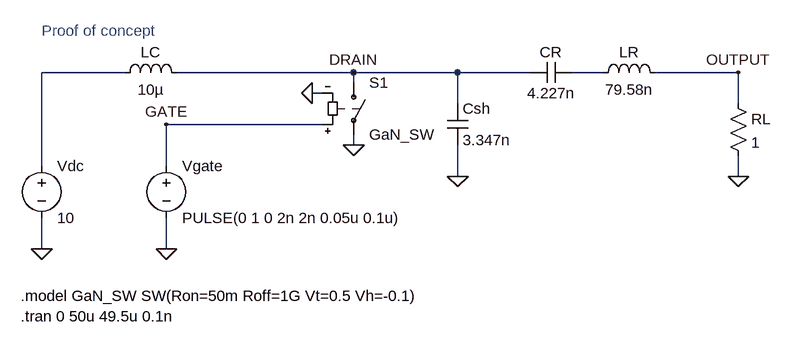
[diagram p0: schematic Class E amplifier.asc]
Class E amplifier.asc, the LTspice schematic file:
Version 4
SHEET 1 1396 680
WIRE 128 -16 0 -16
WIRE 480 -16 208 -16
WIRE 640 -16 480 -16
WIRE 752 -16 640 -16
WIRE 864 -16 816 -16
WIRE 1072 -16 944 -16
WIRE 480 0 480 -16
WIRE 432 16 416 16
WIRE 640 32 640 -16
WIRE 1072 32 1072 -16
WIRE 432 64 192 64
WIRE 480 96 480 80
WIRE 0 128 0 -16
WIRE 192 128 192 64
WIRE 640 144 640 96
WIRE 1072 144 1072 112
WIRE 0 256 0 208
WIRE 192 256 192 208
FLAG 192 256 0
FLAG 0 256 0
FLAG 640 144 0
FLAG 1072 144 0
FLAG 480 96 0
FLAG 416 16 0
FLAG 1072 -16 OUTPUT
FLAG 480 -16 DRAIN
FLAG 192 64 GATE
DATAFLAG 256 -16 ""
SYMBOL voltage 192 112 R0
WINDOW 123 0 0 Left 0
WINDOW 39 0 0 Left 0
SYMATTR InstName Vgate
SYMATTR Value PULSE(0 1 0 2n 2n 0.05u 0.1u)
SYMBOL voltage 0 112 R0
WINDOW 123 0 0 Left 0
WINDOW 39 0 0 Left 0
SYMATTR InstName Vdc
SYMATTR Value 10
SYMBOL ind 112 0 R270
WINDOW 0 32 56 VTop 2
WINDOW 3 5 56 VBottom 2
SYMATTR InstName LC
SYMATTR Value 10µ
SYMBOL cap 624 32 R0
SYMATTR InstName Csh
SYMATTR Value 3.347n
SYMBOL cap 816 -32 R90
WINDOW 0 0 32 VBottom 2
WINDOW 3 32 32 VTop 2
SYMATTR InstName CR
SYMATTR Value 4.227n
SYMBOL ind 848 0 R270
WINDOW 0 32 56 VTop 2
WINDOW 3 5 56 VBottom 2
SYMATTR InstName LR
SYMATTR Value 79.58n
SYMBOL res 1056 16 R0
SYMATTR InstName RL
SYMATTR Value 1
SYMBOL sw 480 -16 R0
SYMATTR InstName S1
SYMATTR Value GaN_SW
TEXT -32 360 Left 2 !.tran 0 50u 49.5u 0.1n
TEXT -32 328 Left 2 !.model GaN_SW SW(Ron=50m Roff=1G Vt=0.5 Vh=-0.1)
TEXT 0 -80 Left 2 ;Proof of concept

The netlist it stands for:
* Class E amplifier.asc
Vgate GATE 0 PULSE(0 1 0 2n 2n 0.05u 0.1u)
Vdc N001 0 10
LC N001 DRAIN 10µ
Csh DRAIN 0 3.347n
CR N002 DRAIN 4.227n
LR N002 OUTPUT 79.58n
RL OUTPUT 0 1
S1 DRAIN 0 GATE 0 GaN_SW
.tran 0 50u 49.5u 0.1n
.model GaN_SW SW(Ron=50m Roff=1G Vt=0.5 Vh=-0.1)
* Proof of concept
.backanno
.end